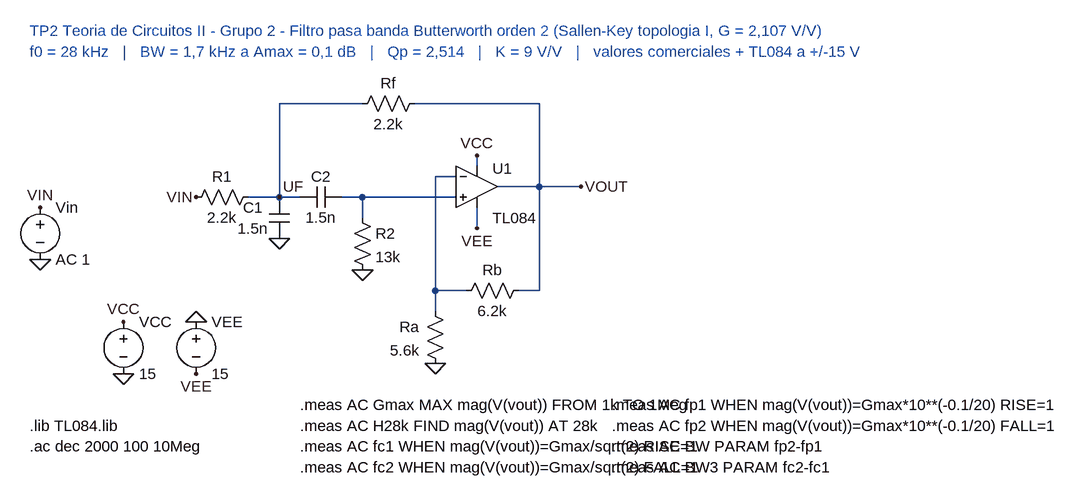
[diagram p0: schematic Filtro_PasaBanda_Orden2_Grupo2.asc]
Filtro_PasaBanda_Orden2_Grupo2.asc, the LTspice schematic file:
Version 4
SHEET 1 1200 640
WIRE 160 144 208 144
WIRE 208 144 240 144
WIRE 304 144 336 144
WIRE 336 144 480 144
WIRE 336 144 336 176
WIRE 208 144 208 0
WIRE 208 0 336 0
WIRE 416 0 608 0
WIRE 608 0 608 128
WIRE 544 128 608 128
WIRE 608 128 672 128
WIRE 480 112 448 112
WIRE 448 112 448 288
WIRE 448 288 448 320
WIRE 448 288 496 288
WIRE 576 288 608 288
WIRE 608 288 608 128
WIRE 512 96 512 80
WIRE 512 160 512 192
FLAG 80 144 VIN
FLAG 208 208 0
FLAG 336 256 0
FLAG 448 400 0
FLAG 512 80 VCC
FLAG 512 192 VEE
FLAG 672 128 VOUT
FLAG 208 144 UF
FLAG -160 160 VIN
FLAG -160 240 0
FLAG -32 336 VCC
FLAG -32 416 0
FLAG 80 336 0
FLAG 80 416 VEE
SYMBOL res 176 128 R90
WINDOW 0 0 56 VBottom 2
WINDOW 3 32 56 VTop 2
SYMATTR InstName R1
SYMATTR Value 2.2k
SYMBOL cap 192 144 R0
WINDOW 0 -40 16 Left 2
WINDOW 3 -48 48 Left 2
SYMATTR InstName C1
SYMATTR Value 1.5n
SYMBOL cap 304 128 R90
WINDOW 0 0 32 VBottom 2
WINDOW 3 32 32 VTop 2
SYMATTR InstName C2
SYMATTR Value 1.5n
SYMBOL res 320 160 R0
SYMATTR InstName R2
SYMATTR Value 13k
SYMBOL res 432 -16 R90
WINDOW 0 0 56 VBottom 2
WINDOW 3 32 56 VTop 2
SYMATTR InstName Rf
SYMATTR Value 2.2k
SYMBOL res 432 304 R0
WINDOW 0 -8 40 Right 2
WINDOW 3 -8 76 Right 2
SYMATTR InstName Ra
SYMATTR Value 5.6k
SYMBOL res 592 272 R90
WINDOW 0 0 56 VBottom 2
WINDOW 3 32 56 VTop 2
SYMATTR InstName Rb
SYMATTR Value 6.2k
SYMBOL OpAmps\\opamp2 512 64 R0
WINDOW 0 24 36 Left 2
WINDOW 3 24 112 Left 2
SYMATTR InstName U1
SYMATTR Value TL084
SYMBOL voltage -160 144 R0
WINDOW 123 24 124 Left 2
WINDOW 39 0 0 Left 0
SYMATTR InstName Vin
SYMATTR Value AC 1
SYMBOL voltage -32 320 R0
WINDOW 123 0 0 Left 0
WINDOW 39 0 0 Left 0
SYMATTR InstName VCC
SYMATTR Value 15
SYMBOL voltage 80 320 R0
WINDOW 123 0 0 Left 0
WINDOW 39 0 0 Left 0
SYMATTR InstName VEE
SYMATTR Value 15
TEXT -176 -112 Left 2 ;TP2 Teoria de Circuitos II - Grupo 2 - Filtro pasa banda Butterworth orden 2 (Sallen-Key topologia I, G = 2,107 V/V)
TEXT -176 -80 Left 2 ;f0 = 28 kHz   |   BW = 1,7 kHz a Amax = 0,1 dB   |   Qp = 2,514   |   K = 9 V/V   |   valores comerciales + TL084 a +/-15 V
TEXT -176 496 Left 2 !.lib TL084.lib
TEXT -176 528 Left 2 !.ac dec 2000 100 10Meg
TEXT 240 464 Left 2 !.meas AC Gmax MAX mag(V(vout)) FROM 1k TO 1Meg
TEXT 240 496 Left 2 !.meas AC H28k FIND mag(V(vout)) AT 28k
TEXT 240 528 Left 2 !.meas AC fc1 WHEN mag(V(vout))=Gmax/sqrt(2) RISE=1
TEXT 240 560 Left 2 !.meas AC fc2 WHEN mag(V(vout))=Gmax/sqrt(2) FALL=1
TEXT 720 464 Left 2 !.meas AC fp1 WHEN mag(V(vout))=Gmax*10**(-0.1/20) RISE=1
TEXT 720 496 Left 2 !.meas AC fp2 WHEN mag(V(vout))=Gmax*10**(-0.1/20) FALL=1
TEXT 720 528 Left 2 !.meas AC BW PARAM fp2-fp1
TEXT 720 560 Left 2 !.meas AC BW3 PARAM fc2-fc1

The netlist it stands for:
* Filtro_PasaBanda_Orden2_Grupo2.asc
R1 UF VIN 2.2k
C1 UF 0 1.5n
C2 N001 UF 1.5n
R2 N001 0 13k
Rf VOUT UF 2.2k
Ra N002 0 5.6k
Rb VOUT N002 6.2k
XU1 N001 N002 VCC VEE VOUT TL084  ; pins In+ In- V+ V- OUT
Vin VIN 0 AC 1
VCC VCC 0 15
VEE 0 VEE 15
* TP2 Teoria de Circuitos II - Grupo 2 - Filtro pasa banda Butterworth orden 2 (Sallen-Key topologia I, G = 2,107 V/V)
* f0 = 28 kHz   |   BW = 1,7 kHz a Amax = 0,1 dB   |   Qp = 2,514   |   K = 9 V/V   |   valores comerciales + TL084 a +/-15 V
.lib TL084.lib
.ac dec 2000 100 10Meg
.meas AC Gmax MAX mag(V(vout)) FROM 1k TO 1Meg
.meas AC H28k FIND mag(V(vout)) AT 28k
.meas AC fc1 WHEN mag(V(vout))=Gmax/sqrt(2) RISE=1
.meas AC fc2 WHEN mag(V(vout))=Gmax/sqrt(2) FALL=1
.meas AC fp1 WHEN mag(V(vout))=Gmax*10**(-0.1/20) RISE=1
.meas AC fp2 WHEN mag(V(vout))=Gmax*10**(-0.1/20) FALL=1
.meas AC BW PARAM fp2-fp1
.meas AC BW3 PARAM fc2-fc1
.backanno
.end